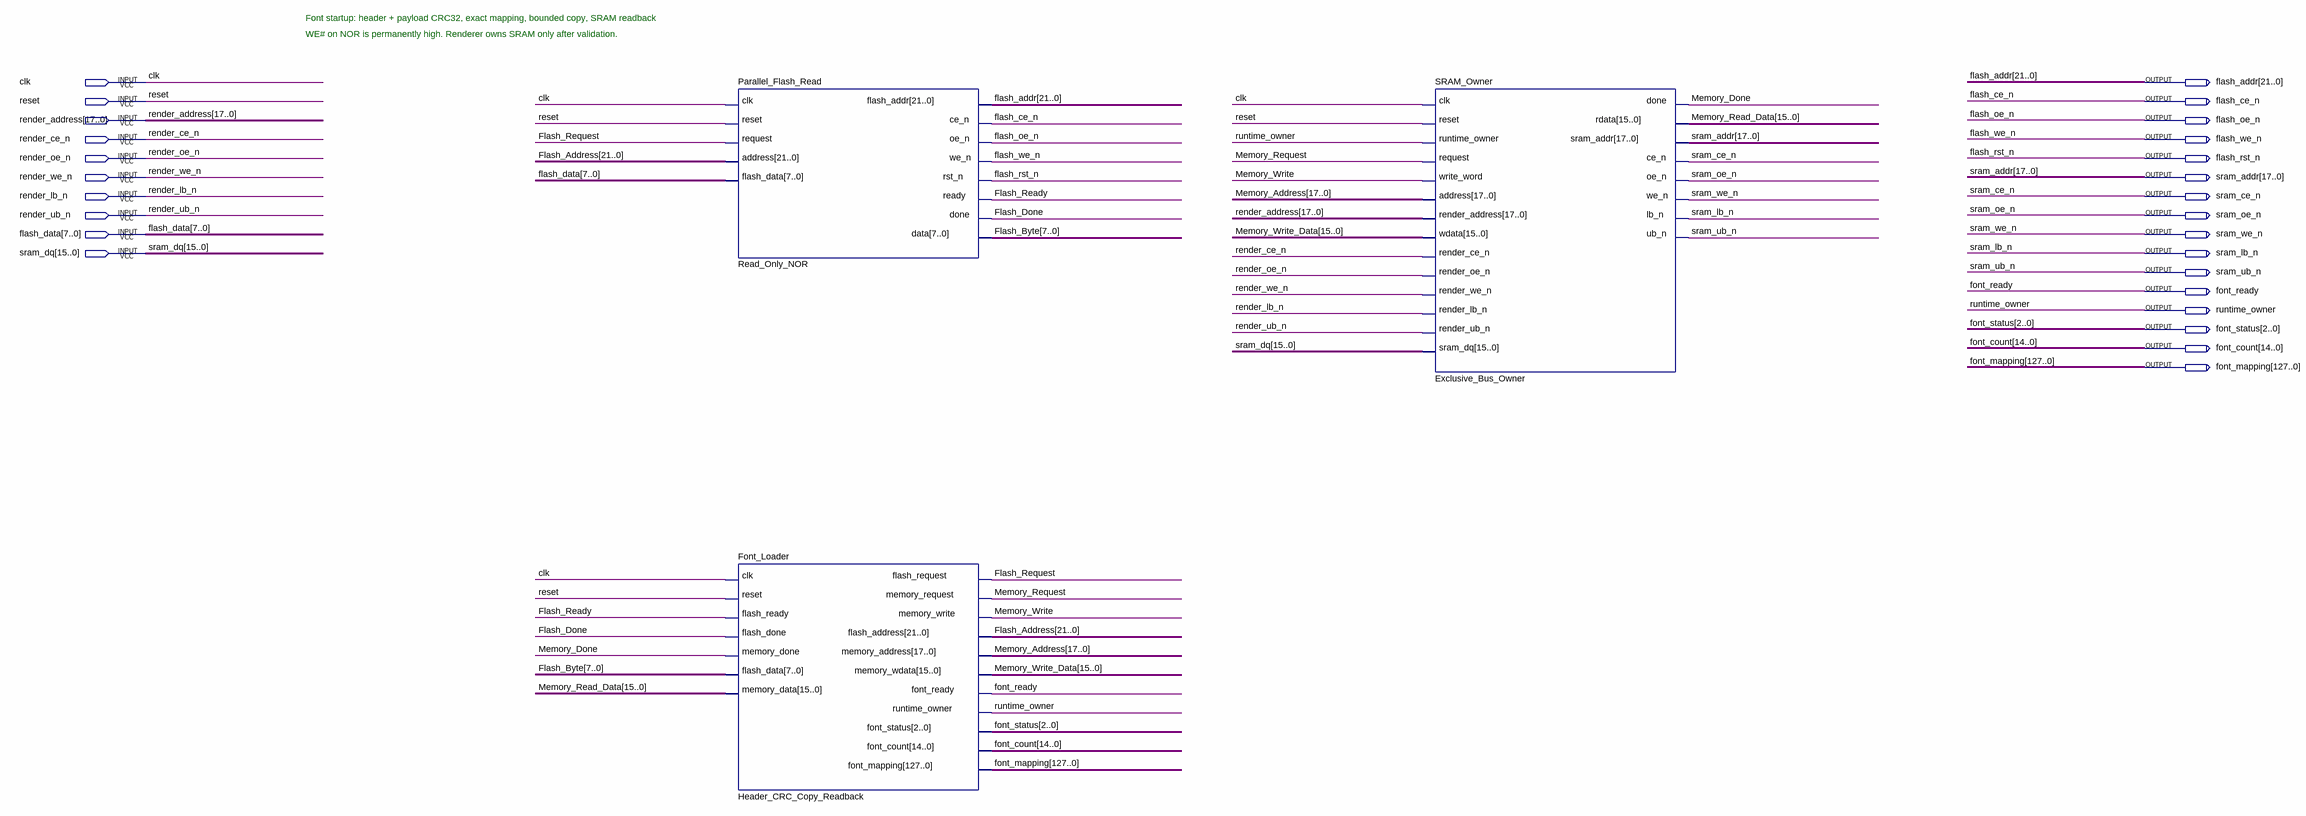
[diagram p0: schematic sheet]
// Quartus schematic Font_Startup.bdf as structural Verilog: 3 symbols, 26 pins
module Font_Startup (
  input  clk,
  input  reset,
  input  [17:0] render_address,
  input  render_ce_n,
  input  render_oe_n,
  input  render_we_n,
  input  render_lb_n,
  input  render_ub_n,
  input  [7:0] flash_data,
  inout  [15:0] sram_dq,
  output [21:0] flash_addr,
  output flash_ce_n,
  output flash_oe_n,
  output flash_we_n,
  output flash_rst_n,
  output [17:0] sram_addr,
  output sram_ce_n,
  output sram_oe_n,
  output sram_we_n,
  output sram_lb_n,
  output sram_ub_n,
  output font_ready,
  output runtime_owner,
  output [2:0] font_status,
  output [14:0] font_count,
  output [127:0] font_mapping
);

  wire Flash_Done, Flash_Ready, Flash_Request, Memory_Done, Memory_Request, Memory_Write;
  wire [7:0] Flash_Byte;
  wire [15:0] Memory_Read_Data, Memory_Write_Data;
  wire [17:0] Memory_Address;
  wire [21:0] Flash_Address;

  Parallel_Flash_Read Read_Only_NOR (
    .clk(clk), .reset(reset), .request(Flash_Request), .address(Flash_Address), .flash_data(flash_data),
    .flash_addr(flash_addr), .ce_n(flash_ce_n), .oe_n(flash_oe_n), .we_n(flash_we_n), .rst_n(flash_rst_n),
    .ready(Flash_Ready), .done(Flash_Done), .data(Flash_Byte));
  Font_Loader Header_CRC_Copy_Readback (
    .clk(clk), .reset(reset), .flash_ready(Flash_Ready), .flash_done(Flash_Done), .memory_done(Memory_Done),
    .flash_data(Flash_Byte), .memory_data(Memory_Read_Data), .flash_request(Flash_Request),
    .memory_request(Memory_Request), .memory_write(Memory_Write), .flash_address(Flash_Address),
    .memory_address(Memory_Address), .memory_wdata(Memory_Write_Data), .font_ready(font_ready),
    .runtime_owner(runtime_owner), .font_status(font_status), .font_count(font_count),
    .font_mapping(font_mapping));
  SRAM_Owner Exclusive_Bus_Owner (
    .clk(clk), .reset(reset), .runtime_owner(runtime_owner), .request(Memory_Request),
    .write_word(Memory_Write), .address(Memory_Address), .render_address(render_address),
    .wdata(Memory_Write_Data), .render_ce_n(render_ce_n), .render_oe_n(render_oe_n),
    .render_we_n(render_we_n), .render_lb_n(render_lb_n), .render_ub_n(render_ub_n), .done(Memory_Done),
    .rdata(Memory_Read_Data), .sram_addr(sram_addr), .ce_n(sram_ce_n), .oe_n(sram_oe_n), .we_n(sram_we_n),
    .lb_n(sram_lb_n), .ub_n(sram_ub_n), .sram_dq(sram_dq));

  // Notes on the sheet:
  //   Font startup: header + payload CRC32, exact mapping, bounded copy, SRAM readback
  //   WE# on NOR is permanently high. Renderer owns SRAM only after validation.
endmodule
